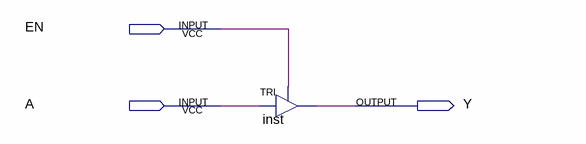
[diagram p0: schematic sheet]
// Quartus schematic tri1bit_hxg.bdf as structural Verilog: 1 symbols, 3 pins
module tri1bit_hxg (
  input  EN,
  input  A,
  output Y
);

  TRI inst (.IN(A), .OE(EN), .OUT(Y));
endmodule
